# Altium schematic sheet LPDDR4X PHY_IO.schdoc
size 420 x 297 mm; Symbol: Drawing-Symbol_A4; Company: 嘉立创EDA; Version: V1.0; Page Size: A4; @Project Name: RK3566; @Update Date: 2026-10-04; @Create Date: 2026-05-19; Device: Drawing-Symbol_A4; @Board Name: Board1; @Page Name: P2; @Create Time: 03:18:35; @Page Count: 6; @Page No: 6; @Schematic Name: Schematic1; @Update Time: 03:18:35; @Assembly Variant: Basic; Border: 1; Title Block Position: 3; Size: A4; Width: 1655; Height: 1170; Region Start: 1; X Region Count: 6; Y Region Count: 4; Blade Width: 10; SheetNumber: 2; SheetTotal: 11
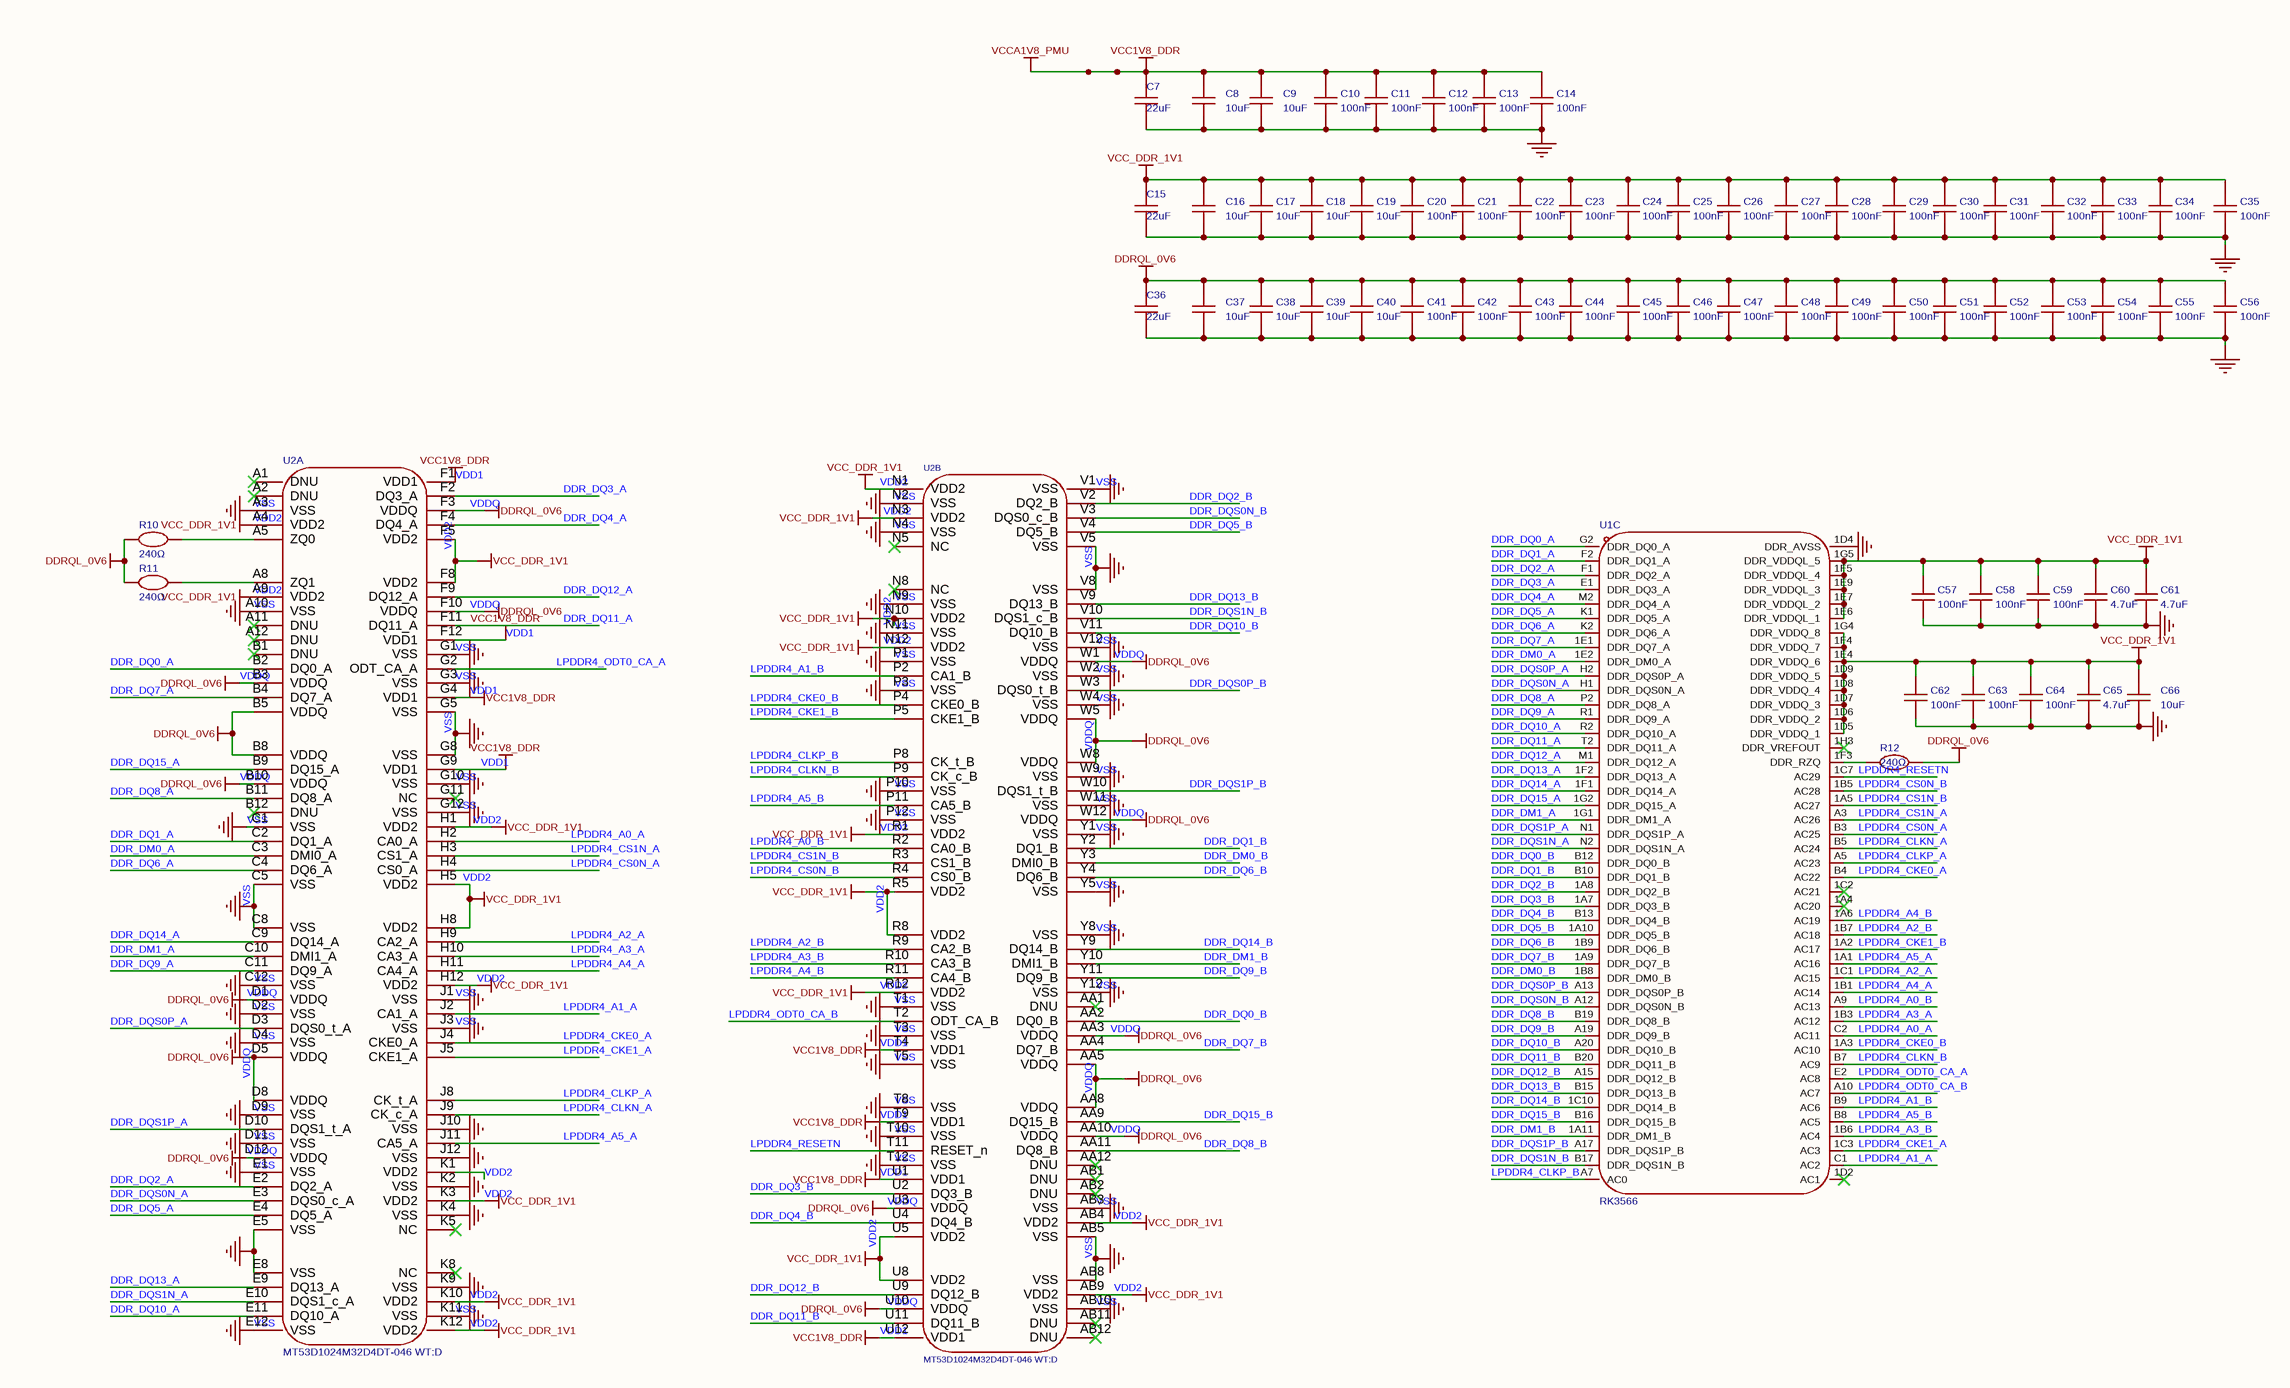
[diagram p0: LPDDR4X PHY_IO.schdoc]

## Parts
C7  22uF  [C0603]
C8  10uF  [C0402]
C9  10uF  [C0402]
C10  100nF  [C0402]
C11  100nF  [C0402]
C12  100nF  [C0402]
C13  100nF  [C0402]
C14  100nF  [C0402]
C15  22uF  [C0603]
C16  10uF  [C0402]
C17  10uF  [C0402]
C18  10uF  [C0402]
C19  10uF  [C0402]
C20  100nF  [C0402]
C21  100nF  [C0402]
C22  100nF  [C0402]
C23  100nF  [C0402]
C24  100nF  [C0402]
C25  100nF  [C0402]
C26  100nF  [C0402]
C27  100nF  [C0402]
C28  100nF  [C0402]
C29  100nF  [C0402]
C30  100nF  [C0402]
C31  100nF  [C0402]
C32  100nF  [C0402]
C33  100nF  [C0402]
C34  100nF  [C0402]
C35  100nF  [C0402]
C36  22uF  [C0603]
C37  10uF  [C0402]
C38  10uF  [C0402]
C39  10uF  [C0402]
C40  10uF  [C0402]
C41  100nF  [C0402]
C42  100nF  [C0402]
C43  100nF  [C0402]
C44  100nF  [C0402]
C45  100nF  [C0402]
C46  100nF  [C0402]
C47  100nF  [C0402]
C48  100nF  [C0402]
C49  100nF  [C0402]
C50  100nF  [C0402]
C51  100nF  [C0402]
C52  100nF  [C0402]
C53  100nF  [C0402]
C54  100nF  [C0402]
C55  100nF  [C0402]
C56  100nF  [C0402]
C57  100nF  [C0201]
C58  100nF  [C0201]
C59  100nF  [C0201]
C60  4.7uF  [C0402]
C61  4.7uF  [C0402]
C62  100nF  [C0201]
C63  100nF  [C0201]
C64  100nF  [C0201]
C65  4.7uF  [C0402]
C66  10uF  [C0603]
R10  240Ω  [R0402]
R11  240Ω  [R0402]
R12  240Ω  [R0402]
U1  RK3566  [BGA-565_L15.5-W14.4-P0.40_RK3566_1]  (part C of 8)
U2  MT53D1024M32D4DT-046 WT:D  [VFBGA-200_L14.5-W10.0-BL_MT53D1024M32D4DT]  (parts A,B of 2)

## Nets
VDD1: C7.2 C8.2 C9.2 C10.2 C11.2 C12.2 C13.2 C14.2 U2.F1(VDD1) U2.F12(VDD1) U2.G4(VDD1) U2.G9(VDD1) U2.T4(VDD1) U2.T9(VDD1) U2.U1(VDD1) U2.U12(VDD1)  [also labelled VCC1V8_DDR, VCCA1V8_PMU]
VDD2: C15.2 C16.2 C17.2 C18.2 C19.2 C20.2 C21.2 C22.2 C23.2 C24.2 C25.2 C26.2 C27.2 C28.2 C29.2 C30.2 C31.2 C32.2 C33.2 C34.2 C35.2 C57.2 C58.2 C59.2 C60.2 C61.2 C62.2 C63.2 C64.2 C65.2 C66.2 U1.1D5(DDR_VDDQ_1) U1.1D6(DDR_VDDQ_2) U1.1D7(DDR_VDDQ_3) U1.1D8(DDR_VDDQ_4) U1.1D9(DDR_VDDQ_5) U1.1E4(DDR_VDDQ_6) U1.1E6(DDR_VDDQL_1) U1.1E7(DDR_VDDQL_2) U1.1E9(DDR_VDDQL_3) U1.1F4(DDR_VDDQ_7) U1.1F5(DDR_VDDQL_4) U1.1G4(DDR_VDDQ_8) U1.1G5(DDR_VDDQL_5) U2.A4(VDD2) U2.A9(VDD2) U2.AB4(VDD2) U2.AB9(VDD2) U2.F5(VDD2) U2.F8(VDD2) U2.H1(VDD2) U2.H5(VDD2) U2.H8(VDD2) U2.H12(VDD2) U2.K1(VDD2) U2.K3(VDD2) U2.K10(VDD2) U2.K12(VDD2) U2.N1(VDD2) U2.N3(VDD2) U2.N10(VDD2) U2.N12(VDD2) U2.R1(VDD2) U2.R5(VDD2) U2.R8(VDD2) U2.R12(VDD2) U2.U5(VDD2) U2.U8(VDD2)  [also labelled VCC_DDR_1V1]
VDDQ: C36.2 C37.2 C38.2 C39.2 C40.2 C41.2 C42.2 C43.2 C44.2 C45.2 C46.2 C47.2 C48.2 C49.2 C50.2 C51.2 C52.2 C53.2 C54.2 C55.2 C56.2 R10.1 R11.1 R12.1 U2.AA3(VDDQ) U2.AA5(VDDQ) U2.AA8(VDDQ) U2.AA10(VDDQ) U2.B3(VDDQ) U2.B5(VDDQ) U2.B8(VDDQ) U2.B10(VDDQ) U2.D1(VDDQ) U2.D5(VDDQ) U2.D8(VDDQ) U2.D12(VDDQ) U2.F3(VDDQ) U2.F10(VDDQ) U2.U3(VDDQ) U2.U10(VDDQ) U2.W1(VDDQ) U2.W5(VDDQ) U2.W8(VDDQ) U2.W12(VDDQ)  [also labelled DDRQL_0V6]
VSS: C7.1 C8.1 C9.1 C10.1 C11.1 C12.1 C13.1 C14.1 C15.1 C16.1 C17.1 C18.1 C19.1 C20.1 C21.1 C22.1 C23.1 C24.1 C25.1 C26.1 C27.1 C28.1 C29.1 C30.1 C31.1 C32.1 C33.1 C34.1 C35.1 C36.1 C37.1 C38.1 C39.1 C40.1 C41.1 C42.1 C43.1 C44.1 C45.1 C46.1 C47.1 C48.1 C49.1 C50.1 C51.1 C52.1 C53.1 C54.1 C55.1 C56.1 C57.1 C58.1 C59.1 C60.1 C61.1 C62.1 C63.1 C64.1 C65.1 C66.1 U1.1D4(DDR_AVSS) U2.A3(VSS) U2.A10(VSS) U2.AB3(VSS) U2.AB5(VSS) U2.AB8(VSS) U2.AB10(VSS) U2.C1(VSS) U2.C5(VSS) U2.C8(VSS) U2.C12(VSS) U2.D2(VSS) U2.D4(VSS) U2.D9(VSS) U2.D11(VSS) U2.E1(VSS) U2.E5(VSS) U2.E8(VSS) U2.E12(VSS) U2.G1(VSS) U2.G3(VSS) U2.G5(VSS) U2.G8(VSS) U2.G10(VSS) U2.G12(VSS) U2.J1(VSS) U2.J3(VSS) U2.J10(VSS) U2.J12(VSS) U2.K2(VSS) U2.K4(VSS) U2.K9(VSS) U2.K11(VSS) U2.N2(VSS) U2.N4(VSS) U2.N9(VSS) U2.N11(VSS) U2.P1(VSS) U2.P3(VSS) U2.P10(VSS) U2.P12(VSS) U2.T1(VSS) U2.T3(VSS) U2.T5(VSS) U2.T8(VSS) U2.T10(VSS) U2.T12(VSS) U2.V1(VSS) U2.V5(VSS) U2.V8(VSS) U2.V12(VSS) U2.W2(VSS) U2.W4(VSS) U2.W9(VSS) U2.W11(VSS) U2.Y1(VSS) U2.Y5(VSS) U2.Y8(VSS) U2.Y12(VSS)  [also labelled GND]
DDR_DM0_A: U1.1E2(DDR_DM0_A) U2.C3(DMI0_A)
DDR_DM0_B: U1.1B8(DDR_DM0_B) U2.Y3(DMI0_B)
DDR_DM1_A: U1.1G1(DDR_DM1_A) U2.C10(DMI1_A)
DDR_DM1_B: U1.1A11(DDR_DM1_B) U2.Y10(DMI1_B)
DDR_DQ0_A: U1.G2(DDR_DQ0_A) U2.B2(DQ0_A)
DDR_DQ0_B: U1.B12(DDR_DQ0_B) U2.AA2(DQ0_B)
DDR_DQ1_A: U1.F2(DDR_DQ1_A) U2.C2(DQ1_A)
DDR_DQ1_B: U1.B10(DDR_DQ1_B) U2.Y2(DQ1_B)
DDR_DQ2_A: U1.F1(DDR_DQ2_A) U2.E2(DQ2_A)
DDR_DQ2_B: U1.1A8(DDR_DQ2_B) U2.V2(DQ2_B)
DDR_DQ3_A: U1.E1(DDR_DQ3_A) U2.F2(DQ3_A)
DDR_DQ3_B: U1.1A7(DDR_DQ3_B) U2.U2(DQ3_B)
DDR_DQ4_A: U1.M2(DDR_DQ4_A) U2.F4(DQ4_A)
DDR_DQ4_B: U1.B13(DDR_DQ4_B) U2.U4(DQ4_B)
DDR_DQ5_A: U1.K1(DDR_DQ5_A) U2.E4(DQ5_A)
DDR_DQ5_B: U1.1A10(DDR_DQ5_B) U2.V4(DQ5_B)
DDR_DQ6_A: U1.K2(DDR_DQ6_A) U2.C4(DQ6_A)
DDR_DQ6_B: U1.1B9(DDR_DQ6_B) U2.Y4(DQ6_B)
DDR_DQ7_A: U1.1E1(DDR_DQ7_A) U2.B4(DQ7_A)
DDR_DQ7_B: U1.1A9(DDR_DQ7_B) U2.AA4(DQ7_B)
DDR_DQ8_A: U1.P2(DDR_DQ8_A) U2.B11(DQ8_A)
DDR_DQ8_B: U1.B19(DDR_DQ8_B) U2.AA11(DQ8_B)
DDR_DQ9_A: U1.R1(DDR_DQ9_A) U2.C11(DQ9_A)
DDR_DQ9_B: U1.A19(DDR_DQ9_B) U2.Y11(DQ9_B)
DDR_DQ10_A: U1.R2(DDR_DQ10_A) U2.E11(DQ10_A)
DDR_DQ10_B: U1.A20(DDR_DQ10_B) U2.V11(DQ10_B)
DDR_DQ11_A: U1.T2(DDR_DQ11_A) U2.F11(DQ11_A)
DDR_DQ11_B: U1.B20(DDR_DQ11_B) U2.U11(DQ11_B)
DDR_DQ12_A: U1.M1(DDR_DQ12_A) U2.F9(DQ12_A)
DDR_DQ12_B: U1.A15(DDR_DQ12_B) U2.U9(DQ12_B)
DDR_DQ13_A: U1.1F2(DDR_DQ13_A) U2.E9(DQ13_A)
DDR_DQ13_B: U1.B15(DDR_DQ13_B) U2.V9(DQ13_B)
DDR_DQ14_A: U1.1F1(DDR_DQ14_A) U2.C9(DQ14_A)
DDR_DQ14_B: U1.1C10(DDR_DQ14_B) U2.Y9(DQ14_B)
DDR_DQ15_A: U1.1G2(DDR_DQ15_A) U2.B9(DQ15_A)
DDR_DQ15_B: U1.B16(DDR_DQ15_B) U2.AA9(DQ15_B)
DDR_DQS0N_A: U1.H1(DDR_DQS0N_A) U2.E3(DQS0_c_A)
DDR_DQS0N_B: U1.A12(DDR_DQS0N_B) U2.V3(DQS0_c_B)
DDR_DQS0P_A: U1.H2(DDR_DQS0P_A) U2.D3(DQS0_t_A)
DDR_DQS0P_B: U1.A13(DDR_DQS0P_B) U2.W3(DQS0_t_B)
DDR_DQS1N_A: U1.N2(DDR_DQS1N_A) U2.E10(DQS1_c_A)
DDR_DQS1N_B: U1.B17(DDR_DQS1N_B) U2.V10(DQS1_c_B)
DDR_DQS1P_A: U1.N1(DDR_DQS1P_A) U2.D10(DQS1_t_A)
DDR_DQS1P_B: U1.A17(DDR_DQS1P_B) U2.W10(DQS1_t_B)
LPDDR4_A0_A: U1.C2(AC11) U2.H2(CA0_A)
LPDDR4_A0_B: U1.A9(AC13) U2.R2(CA0_B)
LPDDR4_A1_A: U1.C1(AC2) U2.J2(CA1_A)
LPDDR4_A1_B: U1.B9(AC6) U2.P2(CA1_B)
LPDDR4_A2_A: U1.1C1(AC15) U2.H9(CA2_A)
LPDDR4_A2_B: U1.1B7(AC18) U2.R9(CA2_B)
LPDDR4_A3_A: U1.1B3(AC12) U2.H10(CA3_A)
LPDDR4_A3_B: U1.1B6(AC4) U2.R10(CA3_B)
LPDDR4_A4_A: U1.1B1(AC14) U2.H11(CA4_A)
LPDDR4_A4_B: U1.1A6(AC19) U2.R11(CA4_B)
LPDDR4_A5_A: U1.1A1(AC16) U2.J11(CA5_A)
LPDDR4_A5_B: U1.B8(AC5) U2.P11(CA5_B)
LPDDR4_CKE0_A: U1.B4(AC22) U2.J4(CKE0_A)
LPDDR4_CKE0_B: U1.1A3(AC10) U2.P4(CKE0_B)
LPDDR4_CKE1_A: U1.1C3(AC3) U2.J5(CKE1_A)
LPDDR4_CKE1_B: U1.1A2(AC17) U2.P5(CKE1_B)
LPDDR4_CLKN_A: U1.B5(AC24) U2.J9(CK_c_A)
LPDDR4_CLKN_B: U1.B7(AC9) U2.P9(CK_c_B)
LPDDR4_CLKP_A: U1.A5(AC23) U2.J8(CK_t_A)
LPDDR4_CLKP_B: U1.A7(AC0) U2.P8(CK_t_B)
LPDDR4_CS0N_A: U1.B3(AC25) U2.H4(CS0_A)
LPDDR4_CS0N_B: U1.1B5(AC28) U2.R4(CS0_B)
LPDDR4_CS1N_A: U1.A3(AC26) U2.H3(CS1_A)
LPDDR4_CS1N_B: U1.1A5(AC27) U2.R3(CS1_B)
LPDDR4_ODT0_CA_A: U1.E2(AC8) U2.G2(ODT_CA_A)
LPDDR4_ODT0_CA_B: U1.A10(AC7) U2.T2(ODT_CA_B)
LPDDR4_RESETN: U1.1C7(AC29) U2.T11(RESET_n)
NetR10_2: R10.2 U2.A5(ZQ0)
NetR11_2: R11.2 U2.A8(ZQ1)
NetR12_2: R12.2 U1.1F3(DDR_RZQ)

Not connected (* = marked no-connect by the designer): U1 1A4(AC20)* 1C2(AC21)* 1D2(AC1)* 1H3(DDR_VREFOUT)*; U2 A1(DNU)* A2(DNU)* A11(DNU)* A12(DNU)* AA1(DNU)* AA12(DNU)* AB1(DNU)* AB2(DNU)* AB11(DNU)* AB12(DNU)* B1(DNU)* B12(DNU)* G11(NC)* K5(NC)* K8(NC)* N5(NC)* N8(NC)*

## Notes on the sheet
- 创建日期
- 2026-10-04
- 原理图
- 板子
- Schematic1
- Board1
- 更新日期
- 图页
- P2
- 绘制
- 审阅
- RK3566
- 版本
- V1.0
- 尺寸
- A4
- 页    6    共    6
- 嘉立创EDA

## Library data of the parts
C7 C15 C36 = HGC0603R5226M100NTHJ: 容值:22uF;精度:±20%;额定电压:10V;温度系数:X5R;; Manufacturer: Chinocera(华瓷); 3D Model: ac125912035d415993ca9572d50418b1聨0819f05c4eef4c71ace90d822a990e87; 3D Model Transform: 62.992,31.496,0,0,0,0,0,0,0; Tolerance: ±20%; Voltage Rating: 10V; Temperature Coefficient: X5R; AddInBom: yes; ModelName: C0603_L1.6-W0.8-H0.8; Symbol: HGC0603R5226M100NTHJ; Device: HGC0603R5226M100NTHJ; LCSC Part Name: 22uF ±20% 10V; Supplier Part: C7432770; Manufacturer Part: HGC0603R5226M100NTHJ; Supplier Footprint: 0603; JLCPCB Part Class: Extended Part; Datasheet: https://item.szlcsc.com/datasheet/HGC0603R5226M100NTHJ/8438252.html; Supplier: LCSC; Value: 22uF; ConvertToPcb: yes; FootprintName: C0603
C8 C9 C16-C19 C37-C40 = HGC0402R5106M100NTEJ: 容值:10uF;精度:±20%;额定电压:10V;温度系数:X5R;; Manufacturer: Chinocera(华瓷); 3D Model: 36a51122f27c49738f86b3bfa98863e0聨0819f05c4eef4c71ace90d822a990e87; 3D Model Transform: 39.37,19.685,0,0,0,0,0,0,0; Tolerance: ±20%; Voltage Rating: 10V; Temperature Coefficient: X5R; AddInBom: yes; ModelName: C0402_L1.0-W0.5-H0.5; Symbol: HGC0402R5106M100NTEJ; Device: HGC0402R5106M100NTEJ; LCSC Part Name: 10uF ±20% 10V; Supplier Part: C7472949; Manufacturer Part: HGC0402R5106M100NTEJ; Supplier Footprint: 0402; JLCPCB Part Class: Extended Part; Datasheet: https://item.szlcsc.com/datasheet/HGC0402R5106M100NTEJ/8532796.html; Supplier: LCSC; Value: 10uF; ConvertToPcb: yes; FootprintName: C0402
C10-C14 C20-C35 C41-C56 = CL05B104KO5NNNC: 容值:100nF;精度:±10%;额定电压:16V;温度系数:X7R;; Manufacturer: SAMSUNG(三星); 3D Model: 36a51122f27c49738f86b3bfa98863e0聨0819f05c4eef4c71ace90d822a990e87; 3D Model Transform: 39.37,19.685,0,0,0,0,0,0,0; Tolerance: ±10%; Voltage Rating: 16V; Temperature Coefficient: X7R; AddInBom: yes; ModelName: C0402_L1.0-W0.5-H0.5; Symbol: CL05B104KO5NNNC; Device: CL05B104KO5NNNC; LCSC Part Name: 100nF ±10% 16V; Supplier Part: C1525; Manufacturer Part: CL05B104KO5NNNC; Supplier Footprint: 0402; JLCPCB Part Class: Basic Part; Datasheet: https://item.szlcsc.com/datasheet/CL05B104KO5NNNC/1877.html; Supplier: LCSC; Value: 100nF; ConvertToPcb: yes; FootprintName: C0402
C57-C59 C62-C64 = GRM033R61E104KE14D: 容值:100nF;精度:±10%;额定电压:25V;温度系数:X5R;; Manufacturer: muRata(村田); AddInBom: yes; ModelId: e8033a7cb35143ffb28e3b81b2577ea0聨0819f05c4eef4c71ace90d822a990e87; ModelName: C0201_L0.6-W0.3-H0.3; ModelTransform: 23.622,11.811,0,0,0,0,0,0,0; Tolerance: ±10%; Voltage Rating: 25V; Temperature Coefficient: X5R; Symbol: GRM033R61E104KE14D; Device: GRM033R61E104KE14D; LCSC Part Name: 100nF ±10% 25V; SupplierPart: C76939; ManufacturerPart: GRM033R61E104KE14D; Supplier Footprint: 0201; JLCPCB Part Class: Extended Part; Datasheet: https://item.szlcsc.com/datasheet/GRM033R61E104KE14D/78066.html; Supplier: LCSC; ConvertToPcb: yes; FootprintName: C0201; Value: 100nF
C60 C61 C65 = CGA0402X5R475M250GT: 容值:4.7uF;精度:±20%;额定电压:25V;温度系数:X5R;; Manufacturer: HRE(芯声); 3D Model: 36a51122f27c49738f86b3bfa98863e0聨0819f05c4eef4c71ace90d822a990e87; 3D Model Transform: 39.37,19.685,0,0,0,0,0,0,0; Tolerance: ±20%; Voltage Rating: 25V; Temperature Coefficient: X5R; AddInBom: yes; ModelName: C0402_L1.0-W0.5-H0.5; Symbol: CGA0402X5R475M250GT; Device: CGA0402X5R475M250GT; LCSC Part Name: 4.7uF ±20% 25V; Supplier Part: C6119795; Manufacturer Part: CGA0402X5R475M250GT; Supplier Footprint: 0402; JLCPCB Part Class: Extended Part; Datasheet: https://item.szlcsc.com/datasheet/CGA0402X5R475M250GT/7062501.html; Supplier: LCSC; Value: 4.7uF; ConvertToPcb: yes; FootprintName: C0402
C66 = CGA0603X5R106K100JT: 容值:10uF;精度:±10%;额定电压:10V;温度系数:X5R;; Manufacturer: HRE(芯声); AddInBom: yes; ModelId: ac125912035d415993ca9572d50418b1聨0819f05c4eef4c71ace90d822a990e87; ModelName: C0603_L1.6-W0.8-H0.8; ModelTransform: 62.992,31.496,0,0,0,0,0,0,0; Tolerance: ±10%; Voltage Rating: 10V; Temperature Coefficient: X5R; Symbol: CGA0603X5R106K100JT; Device: CGA0603X5R106K100JT; LCSC Part Name: 10uF ±10% 10V; SupplierPart: C6119842; ManufacturerPart: CGA0603X5R106K100JT; Supplier Footprint: 0603; JLCPCB Part Class: Extended Part; Datasheet: https://item.szlcsc.com/datasheet/CGA0603X5R106K100JT/7062548.html; Supplier: LCSC; ConvertToPcb: yes; FootprintName: C0603; Value: 10uF
R10-R12 = FRC0402F2400TS: 电阻类型:厚膜电阻;阻值:240Ω;精度:±1%;功率:62.5mW;工作电压:50V;温度系数:±100ppm/℃;; Manufacturer: FOJAN(富捷); AddInBom: yes; ModelId: 98c88bc2b9094f218f3a3e30a7012738聨0819f05c4eef4c71ace90d822a990e87; ModelName: R0402_L1.0-W0.5-H0.4; ModelTransform: 39.37,19.685,0,0,0,0,0,0,0; Tolerance: ±1%; Power(Watts): 62.5mW; Voltage-Supply(Max): 50V; Symbol: FRC0402F2400TS; Device: FRC0402F2400TS; LCSC Part Name: 240Ω ±1% 62.5mW 厚膜电阻; SupplierPart: C2909339; ManufacturerPart: FRC0402F2400TS; Supplier Footprint: 0402; JLCPCB Part Class: Extended Part; Datasheet: https://item.szlcsc.com/datasheet/FRC0402F2400TS/3186274.html; Supplier: LCSC; ConvertToPcb: yes; FootprintName: R0402; Type: 厚膜电阻; Value: 240Ω; Temperature Coefficient: ±100ppm/℃; Operating Temperature: -55℃~+155℃
U1 = RK3566: 是一款高性能、低功耗的四核应用处理器，专为个人移动互联网设备和AIoT设备设计。提供了许多嵌入式强大硬件引擎，以优化高端应用的性能。支持几乎全格式的H.264 4K@60fps解码器、H.265 4K@60fps解码器，还支持H.264/H.265 1080p@60fps编码器、高质量JPEG编码器/解码器。嵌入式3D GPU使其完全兼容OpenGL ES 1.1/2.0/3.2、OpenCL 2.0和Vulkan 1.1; Manufacturer: Rockchip(瑞芯微); Relevance: []; 3D Model: 096be4498db445d8b521581a084e15ec聨0819f05c4eef4c71ace90d822a990e87; 3D Model Transform: 610.235,566.928,0,0,0,0,0,0,0; AddInBom: yes; Symbol: RK3566; Device: RK3566; LCSC Part Name: 表面贴装型开关全行程、动作力等性能; Supplier Part: C2943786; Manufacturer Part: RK3566; Supplier Footprint: BGA-565(15.5x14.4); JLCPCB Part Class: Extended Part; Datasheet: https://item.szlcsc.com/datasheet/RK3566/3329057.html; Supplier: LCSC; ConvertToPcb: yes; FootprintName: BGA-565_L15.5-W14.4-P0.40_RK3566_1; ModelName: BGA-565_L15.5-W14.4-P0.40_RK3566_1
U2 = MT53D1024M32D4DT-046 WT:D_C22437471: 存储器构架(格式):LPDDR4 SDRAM;时钟频率(fc):2.133GHz;存储容量:32Gbit;; Manufacturer: micron(美光); Relevance: []; AddInBom: yes; Memory Size: 32Gbit; Voltage - Supply: 1.1V; Symbol: MT53D1024M32D4DT-046 WT:D_C22437471; Device: MT53D1024M32D4DT-046 WT:D_C22437471; LCSC Part Name: X32 LPDDR4/LPDDR4X SDRAM; SupplierPart: C22437471; ManufacturerPart: MT53D1024M32D4DT-046 WT:D; Supplier Footprint: VFBGA-200(10x14.5); JLCPCB Part Class: Extended Part; Datasheet: https://item.szlcsc.com/datasheet/MT53D1024M32D4DT-046%2520WT%253AD/24072754.html; Supplier: LCSC; ConvertToPcb: yes; FootprintName: VFBGA-200_L14.5-W10.0-BL_MT53D1024M32D4DT; Memory Format: LPDDR4 SDRAM; Clock Frequency: 2.133GHz; Current - Supply: -; Refresh Current: -; Operating Temperature: -30℃~+85℃; Features: 写入均衡功能；自动自刷新；内置温度传感器；自动预充电功能；ZQ校准功能